# Altium project DA-12_MB.PrjPcb (part 4 of 4)

## Sheet ha.SchDoc
size 1188 x 840 mm; SheetNumber: 3; SheetTotal: 3
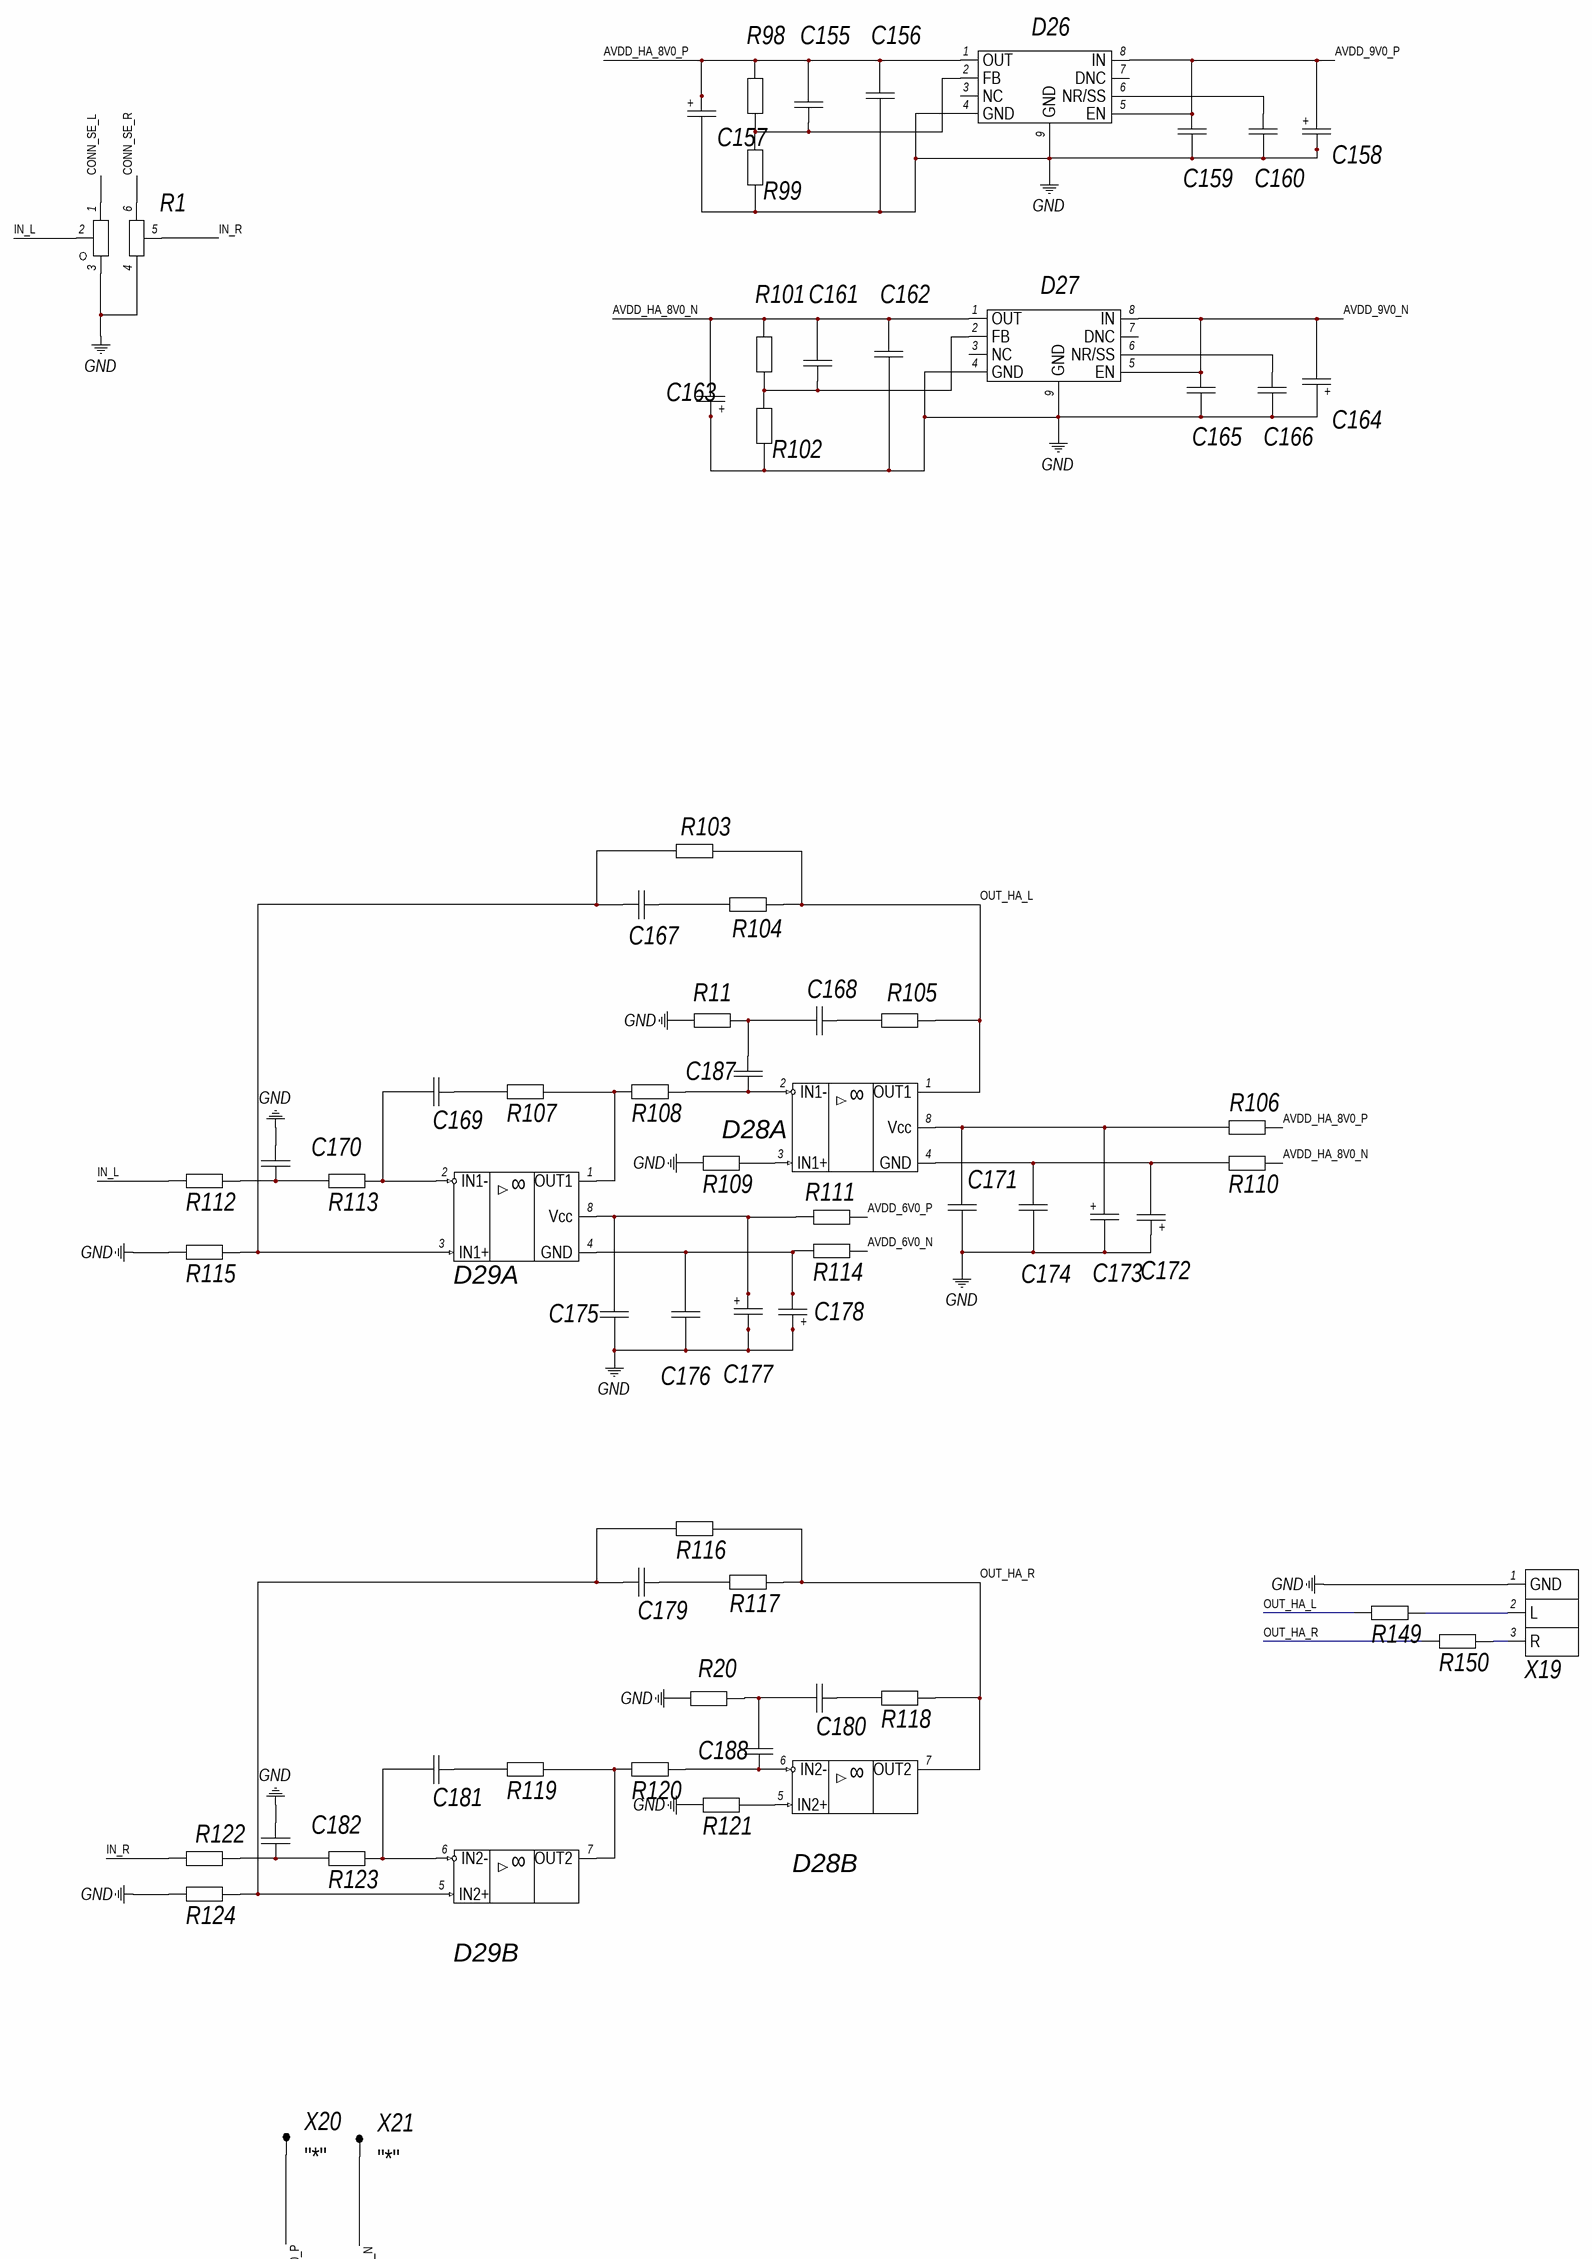
[diagram p13: ha.SchDoc]

### Parts
C155  CC0805MRX7R9BB104  [CAPC200X125X95L50N]  (value not drawn)
C156  CC0805MRX7R9BB104  [CAPC200X125X95L50N]  (value not drawn)
C157  Обозначение при заказе  [TANT_B]  (value not drawn)
C158  Обозначение при заказе  [TANT_B]  (value not drawn)
C159  CC0805MRX7R9BB104  [CAPC200X125X95L50N]  (value not drawn)
C160  CC0805MRX7R9BB104  [CAPC200X125X95L50N]  (value not drawn)
C161  CC0805MRX7R9BB104  [CAPC200X125X95L50N]  (value not drawn)
C162  CC0805MRX7R9BB104  [CAPC200X125X95L50N]  (value not drawn)
C163  Обозначение при заказе  [TANT_B]  (value not drawn)
C164  Обозначение при заказе  [TANT_B]  (value not drawn)
C165  CC0805MRX7R9BB104  [CAPC200X125X95L50N]  (value not drawn)
C166  CC0805MRX7R9BB104  [CAPC200X125X95L50N]  (value not drawn)
C167  CC0805MRX7R9BB104  [CAPC200X125X95L50N]  (value not drawn)
C168  CC0805MRX7R9BB104  [CAPC200X125X95L50N]  (value not drawn)
C169  CC0805MRX7R9BB104  [CAPC200X125X95L50N]  (value not drawn)
C170  CC0805MRX7R9BB104  [CAPC200X125X95L50N]  (value not drawn)
C171  CC0805MRX7R9BB104  [CAPC200X125X95L50N]  (value not drawn)
C172  Обозначение при заказе  [TANT_D]  (value not drawn)
C173  Обозначение при заказе  [TANT_D]  (value not drawn)
C174  CC0805MRX7R9BB104  [CAPC200X125X95L50N]  (value not drawn)
C175  CC0805MRX7R9BB104  [CAPC200X125X95L50N]  (value not drawn)
C176  CC0805MRX7R9BB104  [CAPC200X125X95L50N]  (value not drawn)
C177  Обозначение при заказе  [TANT_B]  (value not drawn)
C178  Обозначение при заказе  [TANT_B]  (value not drawn)
C179  CC0805MRX7R9BB104  [CAPC200X125X95L50N]  (value not drawn)
C180  CC0805MRX7R9BB104  [CAPC200X125X95L50N]  (value not drawn)
C181  CC0805MRX7R9BB104  [CAPC200X125X95L50N]  (value not drawn)
C182  CC0805MRX7R9BB104  [CAPC200X125X95L50N]  (value not drawn)
C187  CC0805MRX7R9BB104  [CAPC200X125X95L50N]  (value not drawn)
C188  CC0805MRX7R9BB104  [CAPC200X125X95L50N]  (value not drawn)
D26  Обозначение при заказе  [SOP65P490X110-9N]  (value not drawn)
D27  Обозначение при заказе  [SOP65P490X110-9N]  (value not drawn)
D28  LM258DR  [SOIC8P127_490X600X175L83X42N]  (value not drawn)  (parts A,B of 2)
D29  LM258DR  [SOIC8P127_490X600X175L83X42N]  (value not drawn)  (parts A,B of 2)
R1  Обозначение при заказе  [RK09L]  (value not drawn)
R11  RC0805JR-071KL  [RESC200X125X60L35]  (value not drawn)
R20  RC0805JR-071KL  [RESC200X125X60L35]  (value not drawn)
R98  RC0805JR-071KL  [RESC200X125X60L35]  (value not drawn)
R99  RC0805JR-071KL  [RESC200X125X60L35]  (value not drawn)
R101  RC0805JR-071KL  [RESC200X125X60L35]  (value not drawn)
R102  RC0805JR-071KL  [RESC200X125X60L35]  (value not drawn)
R103  RC0805JR-071KL  [RESC200X125X60L35]  (value not drawn)
R104  RC0805JR-071KL  [RESC200X125X60L35]  (value not drawn)
R105  RC0805JR-071KL  [RESC200X125X60L35]  (value not drawn)
R106  RC0805JR-071KL  [RESC200X125X60L35]  (value not drawn)
R107  RC0805JR-071KL  [RESC200X125X60L35]  (value not drawn)
R108  RC0805JR-071KL  [RESC200X125X60L35]  (value not drawn)
R109  RC0805JR-071KL  [RESC200X125X60L35]  (value not drawn)
R110  RC0805JR-071KL  [RESC200X125X60L35]  (value not drawn)
R111  RC0805JR-071KL  [RESC200X125X60L35]  (value not drawn)
R112  RC0805JR-071KL  [RESC200X125X60L35]  (value not drawn)
R113  RC0805JR-071KL  [RESC200X125X60L35]  (value not drawn)
R114  RC0805JR-071KL  [RESC200X125X60L35]  (value not drawn)
R115  RC0805JR-071KL  [RESC200X125X60L35]  (value not drawn)
R116  RC0805JR-071KL  [RESC200X125X60L35]  (value not drawn)
R117  RC0805JR-071KL  [RESC200X125X60L35]  (value not drawn)
R118  RC0805JR-071KL  [RESC200X125X60L35]  (value not drawn)
R119  RC0805JR-071KL  [RESC200X125X60L35]  (value not drawn)
R120  RC0805JR-071KL  [RESC200X125X60L35]  (value not drawn)
R121  RC0805JR-071KL  [RESC200X125X60L35]  (value not drawn)
R122  RC0805JR-071KL  [RESC200X125X60L35]  (value not drawn)
R123  RC0805JR-071KL  [RESC200X125X60L35]  (value not drawn)
R124  RC0805JR-071KL  [RESC200X125X60L35]  (value not drawn)
R149  RC0805JR-071KL  [RESC200X125X60L35]  (value not drawn)
R150  RC0805JR-071KL  [RESC200X125X60L35]  (value not drawn)
X19  Обозначение при заказе  [ST-008G-04]  (value not drawn)
X20  Marck-2: "*"  [C_P]  (hidden comment: C_P)  (no BOM)
X21  Marck-2: "*"  [C_P]  (hidden comment: C_P)  (no BOM)

### Nets
GND: C156.2 C157.2 C158.2 C159.2 C160.2 C162.2 C163.1 C164.1 C165.2 C166.2 C170.2 C171.2 C172.1 C173.2 C174.2 C175.2 C176.2 C177.2 C178.1 C182.2 D26.4(GND) D26.9(GND) D27.4(GND) D27.9(GND) R1.3 R1.4 R11.1 R20.1 R99.1 R102.1 R109.1 R115.1 R121.1 R124.1 X19.1(GND)
AVDD_6V0_N: R114.2
AVDD_6V0_P: R111.2
AVDD_9V0_N: C164.2 C165.1 D27.5(EN) D27.8(IN)
AVDD_9V0_P: C158.1 C159.1 D26.5(EN) D26.8(IN)
AVDD_HA_8V0_N: C161.1 C162.1 C163.2 D27.1(OUT) R101.2 R110.2 X21.1
AVDD_HA_8V0_P: C155.1 C156.1 C157.1 D26.1(OUT) R98.2 R106.2 X20.1
CONN_SE_L: R1.1
CONN_SE_R: R1.6
IN_L: R1.2 R112.1
IN_R: R1.5 R122.1
OUT_HA_L: D28.1(OUT1) R103.2 R104.2 R105.2 R149.1
OUT_HA_R: D28.7(OUT2) R116.2 R117.2 R118.2 R150.1
NetC155_2: C155.2 D26.2(FB) R98.1 R99.2
NetC160_1: C160.1 D26.6(NR/SS)
NetC161_2: C161.2 D27.2(FB) R101.1 R102.2
NetC166_1: C166.1 D27.6(NR/SS)
NetC167_1: C167.1 D29.3(IN1+) R103.1 R115.2
NetC167_2: C167.2 R104.1
NetC168_1: C168.1 C187.1 R11.2
NetC168_2: C168.2 R105.1
NetC169_1: C169.1 D29.2(IN1-) R113.2
NetC169_2: C169.2 R107.1
NetC170_1: C170.1 R112.2 R113.1
NetC171_1: C171.1 C173.1 D28.8(Vcc) R106.1
NetC172_2: C172.2 C174.1 D28.4(GND) R110.1
NetC175_1: C175.1 C177.1 D29.8(Vcc) R111.1
NetC176_1: C176.1 C178.2 D29.4(GND) R114.1
NetC179_1: C179.1 D29.5(IN2+) R116.1 R124.2
NetC179_2: C179.2 R117.1
NetC180_1: C180.1 C188.1 R20.2
NetC180_2: C180.2 R118.1
NetC181_1: C181.1 D29.6(IN2-) R123.2
NetC181_2: C181.2 R119.1
NetC182_1: C182.1 R122.2 R123.1
NetC187_2: C187.2 D28.2(IN1-) R108.2
NetC188_2: C188.2 D28.6(IN2-) R120.2
NetD28_3: D28.3(IN1+) R109.2
NetD28_5: D28.5(IN2+) R121.2
NetD29_1: D29.1(OUT1) R107.2 R108.1
NetD29_7: D29.7(OUT2) R119.2 R120.1
NetR149_2: R149.2 X19.2(L)
NetR150_2: R150.2 X19.3(R)

Not connected (* = marked no-connect by the designer): D26 3(NC) 7(DNC); D27 3(NC) 7(DNC)

### Notes on the sheet
- Подп. дата
- Инв. № дубл.
- Взам. инв. №
- Подп. и дата
- Инв. № подл.
- Изм.
- Лист
- № докум.
- Подп.
- Дата
- ALTIUM GOSTBOM2.0 KEV
- Файл:
- Копировал
- Формат А0
- (in symbol LM258DR, part A) ∞
- (in symbol LM258DR, part B) ∞
- (in symbol TANT_B) +
- (in symbol TANT_D) +

### Library data of the parts
C155 C156 C159-C162 C165 C166 C187 C188 = CC0805MRX7R9BB104: Ceramic capacitor 0805 X7R 0.1µF 50V; Manufacturer 1: Yageo; Tolerance: 20%; Capacitance: 100nF; Value: 0.1u; Type: Конденсатор; Supplier 1: Digi-Key; Supplier Part Number 1: 311-4351-1-ND; Manufacturer Part Number 1: CC0805MRX7R9BB104; RoHS: Yes; Category: Ceramic Capacitors; Stock 1: 29978; Pricing 1: 1=0,15000, 10=0,10700, 50=0,06080, 100=0,05040, 500=0,03536, 1000=0,02927 (USD); Mount: SMT; Case/Package: 0805; Min Operating Temperature: -55°C; Max Operating Temperature: 125°C; Packaging: Tape and Reel; Dielectric: X7R; Voltage Rating: 50V; Voltage Rating (DC): 50V; Series: CC; Length: 0.079inch; Width: 0.049inch; Thickness: 0.037inch; Depth: 1.25mm; Lead Free: Lead Free; Halogen Free: Halogen Free; RoHS Compliant: Yes; ComponentLink1URL: https://datasheet.ciiva.com/13207/upy-gphc-x7r-6-3v-to-50v-8-12304-13207535.pdf?src-supplier=Mouser; ComponentLink1Description: https://datasheet.ciiva.com/13207/upy-gphc-x7r-6-3v-to-50v-8-12304-13207535.pdf?src-supplier=Mouser; Case Code (Imperial): 0805; Case Code (Metric): 2012; Voltage: 50V
C157 C158 C163 C164 C177 C178 = TANT_B: Описание свойств компонента
C167-C171 C174-C176 C179-C182 = CC0805MRX7R9BB104: Ceramic capacitor 0805 X7R 0.1µF 50V; Manufacturer 1: Yageo; Capacitance: 100nF; Tolerance: 20%; Value: 0.1u; Type: Конденсатор; Supplier 1: Digi-Key; Supplier Part Number 1: 311-4351-1-ND; Manufacturer Part Number 1: CC0805MRX7R9BB104; RoHS: Yes; Category: Ceramic Capacitors; Stock 1: 29978; Pricing 1: 1=0,15000, 10=0,10700, 50=0,06080, 100=0,05040, 500=0,03536, 1000=0,02927 (USD); Mount: SMT; Case/Package: 0805; Case Code (Metric): 2012; Case Code (Imperial): 0805; Min Operating Temperature: -55°C; Max Operating Temperature: 125°C; Dielectric: X7R; Packaging: Tape and Reel; Voltage Rating: 50V; Voltage Rating (DC): 50V; Voltage: 50V; Series: CC; Length: 0.079inch; Width: 0.049inch; Thickness: 0.037inch; Depth: 1.25mm; Lead Free: Lead Free; RoHS Compliant: Yes; ComponentLink1URL: https://datasheet.ciiva.com/13207/upy-gphc-x7r-6-3v-to-50v-8-12304-13207535.pdf?src-supplier=Mouser; ComponentLink1Description: https://datasheet.ciiva.com/13207/upy-gphc-x7r-6-3v-to-50v-8-12304-13207535.pdf?src-supplier=Mouser; Halogen Free: Halogen Free
C172 C173 = TANT_D: Описание свойств компонента
D26 D27 = TPS7A4901/3001: Описание свойств компонента
D28 D29 = LM258DR: Dual standard, industrial-grade, operational amplifier 8-SOIC -25 to 85; Manufacturer 1: Texas Instruments; Bandwidth: 1MHz; Min Dual Supply Voltage: 3.5V; Max Dual Supply Voltage: 18V; Voltage Gain: 75.56dB; Dual Supply Voltage: 9V; Nominal Supply Current: 500uA; Common Mode Rejection Ratio: 80dB; Number of Channels: 2; Slew Rate: 3.5V/µs; Max I/O Voltage: 6mV; Input Offset Voltage (Vos): 3mV; Input Bias Current: 200pA; Operating Supply Current: 200uA; Output Current: 30mA; Min Supply Voltage: 3V; Amplifier Type: GENERAL PURPOSE; Supply Current: 1.2mA; Type: Микросхема; Value: LM258; Manufacturer Part Number 1: LM258DR; RoHS: Yes; Category: Amplifiers - Op Amps, Buffer, Instrumentation; Stock 1: 59536; Pricing 1: 2500=0,11900 (USD); Case/Package: SOIC-8-150; Number of Pins: 8; Min Operating Temperature: -40°C; Max Operating Temperature: 85°C; Unity Gain Bandwidth Product: 1MHz; Packaging: Rail/Tube; Package Quantity: 50; Nominal Gain Bandwidth Product: 1MHz; Gain Bandwidth Product: 1MHz; Number of Circuits: 2; Number of Elements: 2; Operating Supply Voltage: 18V; Number of Amplifiers: 2; Max Supply Current: 500uA; Length: 9.81mm; Width: 6.35mm; Height: 4.57mm; Radiation Hardening: No; Lead Free: Lead Free; RoHS Compliant: Yes; REACH SVHC: No SVHC; ComponentLink1URL: https://datasheet.ciiva.com/27051/1063193-27051334.pdf?src-supplier=Jameco; ComponentLink1Description: https://datasheet.ciiva.com/27051/1063193-27051334.pdf?src-supplier=Jameco; ComponentLink2URL: https://datasheet.ciiva.com/7738/1768032-7738657.pdf?src-supplier=Element14; ComponentLink2Description: https://datasheet.ciiva.com/7738/1768032-7738657.pdf?src-supplier=Element14; ComponentLink3URL: https://datasheet.ciiva.com/14151/tl06x-series-eng-tds-14151159.pdf?src-supplier=Distrelec; ComponentLink3Description: https://datasheet.ciiva.com/14151/tl06x-series-eng-tds-14151159.pdf?src-supplier=Distrelec; ComponentLink4URL: https://datasheet.ciiva.com/1797/tl062a-1797198.pdf?src-supplier=Digi-Key; ComponentLink4Description: https://datasheet.ciiva.com/1797/tl062a-1797198.pdf?src-supplier=Digi-Key; Manufacturer 2: Texas Instruments; Manufacturer Part Number 2: TL062ID; Stock 2: 9100; Pricing 2: 1=1,40000, 10=1,25400, 25=1,19000, 100=0,97760, 250=0,91388, 500=0,80762, 1000=0,70175 (USD); Contact Plating: Gold; Max Supply Voltage: 18V; ComponentLink5URL: https://datasheet.ciiva.com/15129/getdatasheetpartid-40375-15129693.pdf?src-supplier=Verical; ComponentLink5Description: https://datasheet.ciiva.com/15129/getdatasheetpartid-40375-15129693.pdf?src-supplier=Verical; ComponentLink6URL: https://datasheet.ciiva.com/1797/tl062a-1797276.pdf?src-supplier=Digi-Key; ComponentLink6Description: https://datasheet.ciiva.com/1797/tl062a-1797276.pdf?src-supplier=Digi-Key; ComponentLink7URL: https://datasheet.ciiva.com/7738/1634178-7738543.pdf?src-supplier=Element14; ComponentLink7Description: https://datasheet.ciiva.com/7738/1634178-7738543.pdf?src-supplier=Element14; ComponentLink8URL: https://datasheet.ciiva.com/2974/tl062-2974181.pdf?src-supplier=Avnet; ComponentLink8Description: https://datasheet.ciiva.com/2974/tl062-2974181.pdf?src-supplier=Avnet; ComponentLink9URL: https://datasheet.ciiva.com/48712/001011491-da-01-en-ic-opamp-jfet-1mhz-du-tl062id-soic-8-tid-48712330.pdf?src-supplier=Conrad; ComponentLink9Description: https://datasheet.ciiva.com/48712/001011491-da-01-en-ic-opamp-jfet-1mhz-du-tl062id-soic-8-tid-48712330.pdf?src-supplier=Conrad; Mount: SMT; Output Current per Channel: 30mA; Series: -; Technology: BIPOLAR; ComponentLink10URL: https://datasheet.ciiva.com/34302/1342934-34302235.pdf?src-supplier=Jameco; ComponentLink10Description: https://datasheet.ciiva.com/34302/1342934-34302235.pdf?src-supplier=Jameco; ComponentLink11URL: https://datasheet.ciiva.com/1795/lm258a-1795505.pdf?src-supplier=Digi-Key; ComponentLink11Description: https://datasheet.ciiva.com/1795/lm258a-1795505.pdf?src-supplier=Digi-Key; ComponentLink12URL: https://datasheet.ciiva.com/1795/lm258a-1795506.pdf?src-supplier=Digi-Key; ComponentLink12Description: https://datasheet.ciiva.com/1795/lm258a-1795506.pdf?src-supplier=Digi-Key; ComponentLink13URL: https://datasheet.ciiva.com/1795/lm258a-1795507.pdf?src-supplier=Digi-Key; ComponentLink13Description: https://datasheet.ciiva.com/1795/lm258a-1795507.pdf?src-supplier=Digi-Key; ComponentLink14URL: https://datasheet.ciiva.com/2973/lm358a-2973285.pdf?src-supplier=Avnet; ComponentLink14Description: https://datasheet.ciiva.com/2973/lm358a-2973285.pdf?src-supplier=Avnet; ComponentLink15URL: https://datasheet.ciiva.com/26223/lm358a-26223035.pdf?src-supplier=Avnet+Europe; ComponentLink15Description: https://datasheet.ciiva.com/26223/lm358a-26223035.pdf?src-supplier=Avnet+Europe; ComponentLink16URL: https://datasheet.ciiva.com/16464/lm358a-16464604.pdf?src-supplier=Avnet+Asia; ComponentLink16Description: https://datasheet.ciiva.com/16464/lm358a-16464604.pdf?src-supplier=Avnet+Asia; ComponentLink17URL: https://datasheet.ciiva.com/48711/001071481-da-01-en-ic-opamp-gp-700khz-du-lm258dr-soic-8-tid-48711227.pdf?src-supplier=Conrad; ComponentLink17Description: https://datasheet.ciiva.com/48711/001071481-da-01-en-ic-opamp-gp-700khz-du-lm258dr-soic-8-tid-48711227.pdf?src-supplier=Conrad; Supplier 1: Mouser; Supplier Part Number 1: 595-LM258DR
R1 = ALPS_RK09L: Описание свойств компонента
R11 R20 R98 R99 R101 R102 = RC0805JR-071KL: Chip Resistor Surface Mount 0805 1 кОм; Manufacturer 1: Yageo; Resistance: 1kR; Tolerance: 5%; Temperature Coefficient: 100ppm/°C; Power Rating: 125mW; Voltage Rating: 150V; Value: 1k; Supplier 1: RSComponents; Supplier Part Number 1: 1995761; Manufacturer Part Number 1: RC0805JR-071KL; RoHS: Yes; Category: Chip SMD Resistors; Stock 1: 22200; Pricing 1: 5000=0,00300 (GBP); Case/Package: 0805; Contact Plating: Tin,Lead,Matte; Case Code (Imperial): 0805; Case Code (Metric): 2012; Size Code: 0805; Min Operating Temperature: -55°C; Max Operating Temperature: 155°C; Resistor Type: Thick Film; Packaging: Tape and Reel; Termination: SMD/SMT; Features: Moisture Resistant; Series: RC; Max Power Dissipation: 125mW; Number of Terminations: 2; Resistance Tolerance: 5%; Construction: Rectangular; Length: 2mm; Depth: 1.25mm; Radiation Hardening: No; REACH SVHC: Unknown; Lead Free: Lead Free; Military Standard: Not; RoHS Compliant: Yes; ComponentLink1URL: https://datasheet.ciiva.com/46395/444164-46395131.pdf?src-supplier=Element14; ComponentLink1Description: https://datasheet.ciiva.com/46395/444164-46395131.pdf?src-supplier=Element14; ComponentLink2URL: https://datasheet.ciiva.com/12667/rc0805-12667110.pdf?src-supplier=Mouser; ComponentLink2Description: https://datasheet.ciiva.com/12667/rc0805-12667110.pdf?src-supplier=Mouser; ComponentLink3URL: https://datasheet.ciiva.com/7941/442941-7941911.pdf?src-supplier=Element14; ComponentLink3Description: https://datasheet.ciiva.com/7941/442941-7941911.pdf?src-supplier=Element14; ComponentLink4URL: https://datasheet.ciiva.com/7941/442941-7941912.pdf?src-supplier=Element14; ComponentLink4Description: https://datasheet.ciiva.com/7941/442941-7941912.pdf?src-supplier=Element14; ComponentLink5URL: https://datasheet.ciiva.com/15190/getdatasheetpartid-135056-15190037.pdf?src-supplier=Verical; ComponentLink5Description: https://datasheet.ciiva.com/15190/getdatasheetpartid-135056-15190037.pdf?src-supplier=Verical; Mount: SMT; Type: Резистор
R103 R104 R106 R110 R111 R114 R116 R117 R149 R150 = RC0805JR-071KL: Chip Resistor Surface Mount 0805 1 кОм; Manufacturer 1: Yageo; Resistance: 1kR; Power Rating: 125mW; Tolerance: 5%; Voltage Rating: 150V; Temperature Coefficient: 100ppm/°C; Value: 1k; Supplier 1: RSComponents; Supplier Part Number 1: 1995761; Manufacturer Part Number 1: RC0805JR-071KL; RoHS: Yes; Category: Chip SMD Resistors; Stock 1: 22200; Pricing 1: 5000=0,00300 (GBP); Case/Package: 0805; Case Code (Metric): 2012; Case Code (Imperial): 0805; Size Code: 0805; Min Operating Temperature: -55°C; Max Operating Temperature: 155°C; Packaging: Tape and Reel; Resistor Type: Thick Film; Number of Terminations: 2; Termination: SMD/SMT; Max Power Dissipation: 125mW; Series: RC; Resistance Tolerance: 5%; Construction: Rectangular; Length: 2mm; Depth: 1.25mm; REACH SVHC: Unknown; Military Standard: Not; Lead Free: Lead Free; RoHS Compliant: Yes; ComponentLink1URL: https://datasheet.ciiva.com/46395/444164-46395131.pdf?src-supplier=Element14; ComponentLink1Description: https://datasheet.ciiva.com/46395/444164-46395131.pdf?src-supplier=Element14; ComponentLink2URL: https://datasheet.ciiva.com/12667/rc0805-12667110.pdf?src-supplier=Mouser; ComponentLink2Description: https://datasheet.ciiva.com/12667/rc0805-12667110.pdf?src-supplier=Mouser; ComponentLink3URL: https://datasheet.ciiva.com/7941/442941-7941911.pdf?src-supplier=Element14; ComponentLink3Description: https://datasheet.ciiva.com/7941/442941-7941911.pdf?src-supplier=Element14; Mount: SMT; Type: Резистор; Contact Plating: Tin,Lead,Matte; Features: Moisture Resistant; Radiation Hardening: No; ComponentLink4URL: https://datasheet.ciiva.com/7941/442941-7941912.pdf?src-supplier=Element14; ComponentLink4Description: https://datasheet.ciiva.com/7941/442941-7941912.pdf?src-supplier=Element14; ComponentLink5URL: https://datasheet.ciiva.com/15190/getdatasheetpartid-135056-15190037.pdf?src-supplier=Verical; ComponentLink5Description: https://datasheet.ciiva.com/15190/getdatasheetpartid-135056-15190037.pdf?src-supplier=Verical
R105 R107-R109 R118-R121 = RC0805JR-071KL: Chip Resistor Surface Mount 0805 1 кОм; Manufacturer 1: Yageo; Resistance: 1kR; Tolerance: 5%; Power Rating: 125mW; Voltage Rating: 150V; Temperature Coefficient: 100ppm/°C; Value: 1k; Supplier 1: RSComponents; Supplier Part Number 1: 1995761; Manufacturer Part Number 1: RC0805JR-071KL; RoHS: Yes; Category: Chip SMD Resistors; Stock 1: 22200; Pricing 1: 5000=0,00300 (GBP); Case/Package: 0805; Case Code (Imperial): 0805; Case Code (Metric): 2012; Min Operating Temperature: -55°C; Max Operating Temperature: 155°C; Resistor Type: Thick Film; Packaging: Tape and Reel; Termination: SMD/SMT; Number of Terminations: 2; Max Power Dissipation: 125mW; Features: Moisture Resistant; Series: RC; Resistance Tolerance: 5%; Construction: Rectangular; Length: 2mm; Depth: 1.25mm; RoHS Compliant: Yes; REACH SVHC: Unknown; Military Standard: Not; Lead Free: Lead Free; ComponentLink1URL: https://datasheet.ciiva.com/46395/444164-46395131.pdf?src-supplier=Element14; ComponentLink1Description: https://datasheet.ciiva.com/46395/444164-46395131.pdf?src-supplier=Element14; ComponentLink2URL: https://datasheet.ciiva.com/12667/rc0805-12667110.pdf?src-supplier=Mouser; ComponentLink2Description: https://datasheet.ciiva.com/12667/rc0805-12667110.pdf?src-supplier=Mouser; ComponentLink3URL: https://datasheet.ciiva.com/7941/442941-7941911.pdf?src-supplier=Element14; ComponentLink3Description: https://datasheet.ciiva.com/7941/442941-7941911.pdf?src-supplier=Element14; ComponentLink4URL: https://datasheet.ciiva.com/7941/442941-7941912.pdf?src-supplier=Element14; ComponentLink4Description: https://datasheet.ciiva.com/7941/442941-7941912.pdf?src-supplier=Element14; ComponentLink5URL: https://datasheet.ciiva.com/15190/getdatasheetpartid-135056-15190037.pdf?src-supplier=Verical; ComponentLink5Description: https://datasheet.ciiva.com/15190/getdatasheetpartid-135056-15190037.pdf?src-supplier=Verical; Mount: SMT; Type: Резистор; Contact Plating: Tin,Lead,Matte; Size Code: 0805; Radiation Hardening: No
R112 R113 R115 R122-R124 = RC0805JR-071KL: Chip Resistor Surface Mount 0805 1 кОм; Manufacturer 1: Yageo; Tolerance: 5%; Resistance: 1kR; Temperature Coefficient: 100ppm/°C; Power Rating: 125mW; Voltage Rating: 150V; Value: 1k; Supplier 1: RSComponents; Supplier Part Number 1: 1995761; Manufacturer Part Number 1: RC0805JR-071KL; RoHS: Yes; Category: Chip SMD Resistors; Stock 1: 22200; Pricing 1: 5000=0,00300 (GBP); Case/Package: 0805; Case Code (Imperial): 0805; Case Code (Metric): 2012; Min Operating Temperature: -55°C; Max Operating Temperature: 155°C; Resistor Type: Thick Film; Packaging: Tape and Reel; Termination: SMD/SMT; Number of Terminations: 2; Max Power Dissipation: 125mW; Series: RC; Resistance Tolerance: 5%; Construction: Rectangular; Length: 2mm; Depth: 1.25mm; REACH SVHC: Unknown; Lead Free: Lead Free; Military Standard: Not; RoHS Compliant: Yes; ComponentLink1URL: https://datasheet.ciiva.com/46395/444164-46395131.pdf?src-supplier=Element14; ComponentLink1Description: https://datasheet.ciiva.com/46395/444164-46395131.pdf?src-supplier=Element14; ComponentLink2URL: https://datasheet.ciiva.com/12667/rc0805-12667110.pdf?src-supplier=Mouser; ComponentLink2Description: https://datasheet.ciiva.com/12667/rc0805-12667110.pdf?src-supplier=Mouser; ComponentLink3URL: https://datasheet.ciiva.com/7941/442941-7941911.pdf?src-supplier=Element14; ComponentLink3Description: https://datasheet.ciiva.com/7941/442941-7941911.pdf?src-supplier=Element14; ComponentLink4URL: https://datasheet.ciiva.com/7941/442941-7941912.pdf?src-supplier=Element14; ComponentLink4Description: https://datasheet.ciiva.com/7941/442941-7941912.pdf?src-supplier=Element14; ComponentLink5URL: https://datasheet.ciiva.com/15190/getdatasheetpartid-135056-15190037.pdf?src-supplier=Verical; ComponentLink5Description: https://datasheet.ciiva.com/15190/getdatasheetpartid-135056-15190037.pdf?src-supplier=Verical; Mount: SMT; Type: Резистор; Contact Plating: Tin,Lead,Matte; Size Code: 0805; Features: Moisture Resistant; Radiation Hardening: No
X19 = ST-008G-04: Описание свойств компонента
X20 X21 = C_P: Контрольная площадка; Value: 0; Marck-1: *; Case/Package: SMD-1; Mount: SMT; Type: Точка контрольная

## Nets that join several sheets
GND: da12-mb (21 pins), DAC_4493 (127 pins), ha (35 pins)
AVDD_6V0_N: DAC_4493 (10 pins), ha (R114.2)
AVDD_6V0_P: DAC_4493 (10 pins), ha (R111.2)
AVDD_9V0_N: DAC_4493 (9 pins), ha (C164.2 C165.1 D27.5 D27.8)
AVDD_9V0_P: DAC_4493 (9 pins), ha (C158.1 C159.1 D26.5 D26.8)
CONN_SE_L: DAC_4493 (C71.2 R39.2 R44.2 R92.1), ha (R1.1)
CONN_SE_R: DAC_4493 (C126.2 R66.2 R71.2 R96.1), ha (R1.6)
DAC_DVDD_3V3: da12-mb (9 pins), DAC_4493 (10 pins)
DAC_I2C_DATA: da12-mb (D10.7), DAC_4493 (D25.9 R21.2)
DAC_I2C_SCK: da12-mb (D10.6), DAC_4493 (D25.8 R6.2)
DAC_I2S_DATA: da12-mb (R26.1), DAC_4493 (D25.4)
DAC_I2S_LRCK: da12-mb (R25.1), DAC_4493 (D25.5)
DAC_I2S_MCLK: da12-mb (R17.2 R24.1), DAC_4493 (R83.1)
DAC_I2S_SCK: da12-mb (R27.1), DAC_4493 (D25.3)
DAC_I2S_WCK: da12-mb (D30.7), DAC_4493 (D25.6)
DAC_RESET: da12-mb (D12.6), DAC_4493 (D25.2)
DAC_SPI_CSN: da12-mb (D30.6), DAC_4493 (D25.7)
DGND: da12-mb (146 pins), DAC_4493 (8 pins)
USB_5V0: da12-mb (9 pins), DAC_4493 (L14.1 L19.1)